# Altium schematic sheet Right leg drive.SchDoc
size A; SheetNumber: 4; SheetTotal: 5
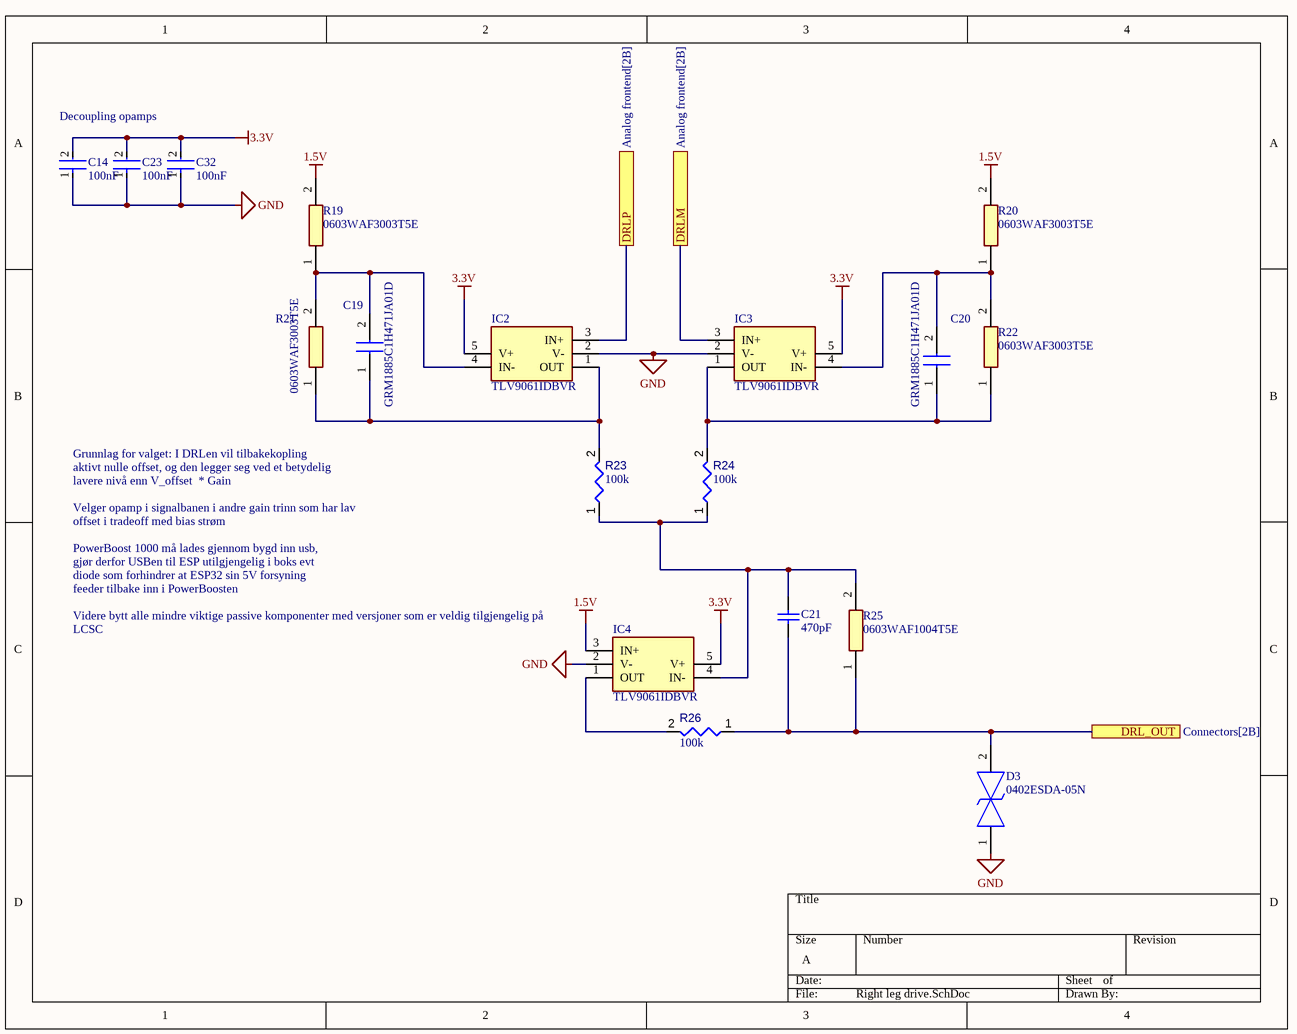
[diagram p0: Right leg drive.SchDoc]

## Parts
C14  value 100nF  [FP-CC0603-DA-IPC_B]  (hidden comment: CC0603KRX7R9BB104)
C19  GRM1885C1H471JA01D  [CAPC1608X90N]
C20  GRM1885C1H471JA01D  [CAPC1608X90N]
C21  value 470pF  [Copy of KGM05DR50J226MH]  (hidden comment: 0402B471K500NT)
C23  value 100nF  [FP-CC0603-DA-IPC_B]  (hidden comment: CC0603KRX7R9BB104)
C32  value 100nF  [FP-CC0603-DA-IPC_B]  (hidden comment: CC0603KRX7R9BB104)
D3  0402ESDA-05N  [DIONC1005X60N]
IC2  TLV9061IDBVR  [SOT95P280X145-5N]
IC3  TLV9061IDBVR  [SOT95P280X145-5N]
IC4  TLV9061IDBVR  [SOT95P280X145-5N]
R19  0603WAF3003T5E  [RESC1608X55N]
R20  0603WAF3003T5E  [RESC1608X55N]
R21  0603WAF3003T5E  [RESC1608X55N]
R22  0603WAF3003T5E  [RESC1608X55N]
R23  value 100k  [0603WAF3304T5E]  (hidden comment: 0603WAF1003T5E)
R24  value 100k  [0603WAF3304T5E]  (hidden comment: 0603WAF1003T5E)
R25  0603WAF1004T5E  [RESC1608X55N]
R26  value 100k  [0603WAF3304T5E]  (hidden comment: 0603WAF1003T5E)

## Ports
DRL_OUT (see Connectors[2B]), DRLM (see Analog frontend[2B]), DRLP (see Analog frontend[2B])

## Nets
1.5V: IC4.3(IN+) R19.2 R20.2
3.3V: C14.2 C23.2 C32.2 IC2.5(V+) IC3.5(V+) IC4.5(V+)
GND: C14.1 C23.1 C32.1 D3.1 IC2.2(V-) IC3.2(V-) IC4.2(V-)
DRL_OUT: C21.1 D3.2 R25.1 R26.1 ; port DRL_OUT
DRLM: IC3.3(IN+) ; port DRLM
DRLP: IC2.3(IN+) ; port DRLP
NetC19_1: C19.1 IC2.1(OUT) R21.1 R23.2
NetC19_2: C19.2 IC2.4(IN-) R19.1 R21.2
NetC20_1: C20.1 IC3.1(OUT) R22.1 R24.2
NetC20_2: C20.2 IC3.4(IN-) R20.1 R22.2
NetC21_2: C21.2 IC4.4(IN-) R23.1 R24.1 R25.2
NetIC4_1: IC4.1(OUT) R26.2

## Notes on the sheet
- Decoupling opamps
- Grunnlag for valget: I DRLen vil tilbakekopling
- aktivt nulle offset, og den legger seg ved et betydelig
- lavere nivå enn V_offset  * Gain
- Velger opamp i signalbanen i andre gain trinn som har lav
- offset i tradeoff med bias strøm
- PowerBoost 1000 må lades gjennom bygd inn usb,
- gjør derfor USBen til ESP utilgjengelig i boks evt
- diode som forhindrer at ESP32 sin 5V forsyning
- feeder tilbake inn i PowerBoosten
- (near IC4) Videre bytt alle mindre viktige passive komponenter med versjoner som er veldig tilgjengelig på
- LCSC

## Library data of the parts
C14 C23 C32 = CMP-001-00148-1: Multilayer Ceramic Capacitor, CC Series, 0.1 - F, - 10%, X7R, 50 V, 0603 [1608 Metric]; Voltage Rating: 50V; Mounting Technology: Surface Mount; Tolerance: 10%; Case/Package: 0603; Max Operating Temperature: 125°C; Min Operating Temperature: -55°C; Pins: 2; Lead Free: Lead Free; Case Code (Metric): 1608; Width: 800µm; Termination: SMD/SMT; Depth: 800µm; RoHS: Compliant; Material: Ceramic; Dielectric: X7R; Schedule B: 8532240020, 8532240020; Country of Origin: Mainland China, Taiwan; Lifecycle Status: Production; Radiation Hardening: No; Case Code (Imperial): 0603; Height: 800µm; Number of Terminals: 2; China RoHS: Compliant; Voltage Rating (DC): 50V; Export Control Classification Number (ECCN) Code: EAR99; Halogen Free: Halogen Free; Thickness: 889µm; Voltage: 50V; Length: 1.6mm; Harmonized Tariff Schedule (HTS) Code: 8532.24.00.20; REACH SVHC: Unaffected; Introduction Date: 2005-08-18; Dielectric Material: Ceramic
C19 C20 = GRM1885C1H471JA01D: Capacitor; Manufacturer_Name: Murata Electronics; Datasheet Link: https://search.murata.co.jp/Ceramy/image/img/A01X/G101/ENG/GRM1885C1H471JA01-01A.pdf; Height: 0.9mm; Manufacturer_Part_Number: GRM1885C1H471JA01D; Mouser Part Number: 81-GRM39C471J50; Mouser Price/Stock: https://www.mouser.co.uk/ProductDetail/Murata-Electronics/GRM1885C1H471JA01D?qs=dDtGB%252BtNe6pvV5u0%2FOvNVA%3D%3D; Arrow Part Number: GRM1885C1H471JA01D; Arrow Price/Stock: https://www.arrow.com/en/products/grm1885c1h471ja01d/murata-manufacturing.html?utm_currency=USD&region=europe
C21 = CMP-001-00150-3: 50V 470pF X7R ±10% 0402 Multilayer Ceramic Capacitors MLCC - SMD/SMT ROHS; Voltage Rating (DC): 50V; Mounting Technology: Surface Mount; Max Operating Temperature: 125°C; Lifecycle Status: Production; RoHS: Compliant; Dielectric Material: Ceramic; Length: 1mm; Width: 500µm; Case/Package: 0402; Height: 500µm; Number of Terminals: 2; REACH SVHC: Unaffected; Min Operating Temperature: -55°C
D3 = 0402ESDA-05N: TVS Diode (Bi-directional); Manufacturer_Name: Bourne Semicon; Datasheet Link: https://datasheet.lcsc.com/szlcsc/1811061308_Bourne-Semicon-Shenzhen-0402ESDA-05N_C316049.pdf; Height: 0.6mm; Manufacturer_Part_Number: 0402ESDA-05N
IC2-IC4 = TLV9061IDBVR: Integrated Circuit; Manufacturer_Name: Texas Instruments; Datasheet Link: http://www.ti.com/lit/gpn/tlv9061; Height: 1.45mm; Manufacturer_Part_Number: TLV9061IDBVR; Mouser Part Number: 595-TLV9061IDBVR; Mouser Price/Stock: https://www.mouser.co.uk/ProductDetail/Texas-Instruments/TLV9061IDBVR?qs=w%2Fv1CP2dgqpra2GA6pq5aQ%3D%3D; Arrow Part Number: TLV9061IDBVR; Arrow Price/Stock: https://www.arrow.com/en/products/tlv9061idbvr/texas-instruments?utm_currency=USD&region=nac
R19-R22 = 0603WAF3003T5E: Resistor; Manufacturer_Name: ROYALOHM; Datasheet Link: https://www.mouser.de/datasheet/2/1365/1-3044649.pdf; Height: 0.55mm; Manufacturer_Part_Number: 0603WAF3003T5E
R23 R24 R26 = CMP-009-00240-1: Fixed Resistor, Metal Glaze/Thick Film, 0.1W, 100000ohm, 75V, 1% +/-Tol, Surface Mount, 0603; Power Rating: 100mW; Working Voltage: 50V; Temperature Coefficient: 100ppm/°C; Harmonized Tariff Schedule (HTS) Code: 8533.21.00.30; REACH SVHC: Unaffected; Height: 450µm; Lifecycle Status: Production; RoHS: Compliant; Length: 1.6mm; Mounting Technology: Surface Mount; Tolerance: 1%; Width: 800µm; Case/Package: 0603; Min Operating Temperature: -55°C; Max Operating Temperature: 155°C; Export Control Classification Number (ECCN) Code: EAR99; Number of Terminals: 2
R25 = 0603WAF1004T5E: Resistor; Manufacturer_Name: ROYALOHM; Datasheet Link: https://eu.mouser.com/datasheet/3/5925/1/1.pdf; Height: 0.55mm; Manufacturer_Part_Number: 0603WAF1004T5E; Mouser Part Number: 303-0603WAF1004T5E; Mouser Price/Stock: https://www.mouser.co.uk/ProductDetail/Royalohm/0603WAF1004T5E?qs=e8oIoAS2J1ROidUp2W57ZQ%3D%3D